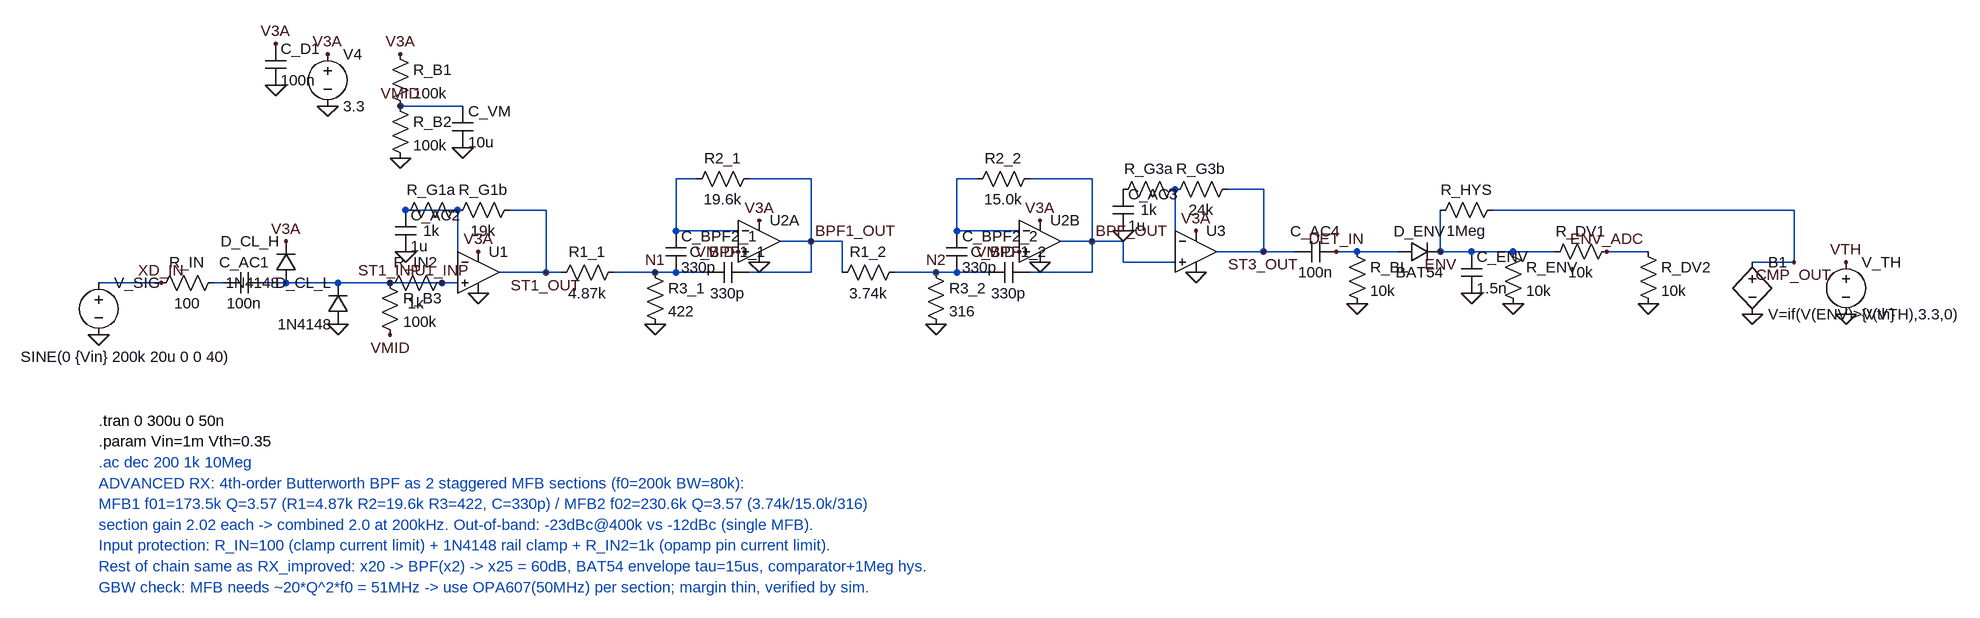
[diagram p0: schematic RX_advanced.asc]
RX_advanced.asc, the LTspice schematic file:
Version 4.1
SHEET 1 2400 900
WIRE -1552 208 -1456 208
WIRE -1376 208 -1360 208
WIRE -1296 208 -1264 208
WIRE -1264 208 -1184 208
WIRE -1184 208 -1104 208
WIRE -1104 208 -1024 208
WIRE -1024 208 -1000 208
WIRE -1088 -64 -992 -64
WIRE -1000 176 -1000 96
WIRE -1000 96 -1080 96
WIRE -920 96 -864 96
WIRE -864 96 -864 192
WIRE -936 192 -864 192
WIRE -864 192 -840 192
WIRE -760 192 -696 192
WIRE -696 192 -664 192
WIRE -664 192 -616 192
WIRE -664 128 -568 128
WIRE -664 128 -664 48
WIRE -664 48 -632 48
WIRE -552 48 -456 48
WIRE -456 48 -456 144
WIRE -504 144 -456 144
WIRE -456 144 -408 144
WIRE -552 192 -456 192
WIRE -456 192 -456 144
WIRE -408 144 -408 192
WIRE -328 192 -264 192
WIRE -264 192 -232 192
WIRE -232 192 -184 192
WIRE -232 128 -136 128
WIRE -232 128 -232 48
WIRE -232 48 -200 48
WIRE -120 48 -24 48
WIRE -24 48 -24 144
WIRE -72 144 -24 144
WIRE -24 144 24 144
WIRE -120 192 -24 192
WIRE -24 192 -24 144
WIRE 24 144 24 176
WIRE 24 176 104 176
WIRE 104 144 104 64
WIRE 184 64 240 64
WIRE 240 64 240 160
WIRE 168 160 240 160
WIRE 240 160 288 160
WIRE 352 160 384 160
WIRE 384 160 416 160
WIRE 416 160 448 160
WIRE 512 160 560 160
WIRE 560 160 624 160
WIRE 624 160 688 160
WIRE 512 160 512 96
WIRE 592 96 1056 96
WIRE 1056 96 1056 176
WIRE 992 176 1056 176
WIRE 768 160 832 160
FLAG -1552 288 0
FLAG -1200 -64 0
FLAG -1088 16 0
FLAG -992 0 0
FLAG -1280 -96 0
FLAG -1200 -144 V3A
FLAG -1280 -160 V3A
FLAG -1088 -144 V3A
FLAG -1088 -64 VMID
FLAG -1264 144 V3A
FLAG -1184 272 0
FLAG -1104 288 VMID
FLAG -1080 160 0
FLAG -968 160 V3A
FLAG -968 224 0
FLAG -696 272 0
FLAG -568 160 VMID
FLAG -536 112 V3A
FLAG -536 176 0
FLAG -264 272 0
FLAG -136 160 VMID
FLAG -104 112 V3A
FLAG -104 176 0
FLAG 24 128 0
FLAG 136 128 V3A
FLAG 136 192 0
FLAG 384 240 0
FLAG 560 224 0
FLAG 624 240 0
FLAG 832 240 0
FLAG 992 256 0
FLAG 1136 256 0
FLAG -1456 208 XD_IN
FLAG -1104 208 ST1_INP
FLAG -1024 208 U1_INP
FLAG -864 192 ST1_OUT
FLAG -696 192 N1
FLAG -456 144 BPF1_OUT
FLAG -264 192 N2
FLAG -24 144 BPF_OUT
FLAG 240 160 ST3_OUT
FLAG 352 160 DET_IN
FLAG 512 160 ENV
FLAG 768 160 ENV_ADC
FLAG 1056 176 CMP_OUT
FLAG 1136 176 VTH
SYMBOL voltage -1552 192 R0
WINDOW 3 -120 130 Left 2
SYMATTR InstName V_SIG
SYMATTR Value SINE(0 {Vin} 200k 20u 0 0 40)
SYMATTR Value2 AC 1
SYMBOL res -1360 192 R90
WINDOW 0 0 56 VBottom 2
WINDOW 3 32 56 VTop 2
SYMATTR InstName R_IN
SYMATTR Value 100
SYMBOL cap -1296 192 R90
WINDOW 0 0 32 VBottom 2
WINDOW 3 32 32 VTop 2
SYMATTR InstName C_AC1
SYMATTR Value 100n
SYMBOL diode -1248 208 R180
WINDOW 0 24 64 Left 2
WINDOW 3 24 0 Left 2
SYMATTR InstName D_CL_H
SYMATTR Value 1N4148
SYMBOL diode -1168 272 R180
WINDOW 0 24 64 Left 2
WINDOW 3 24 0 Left 2
SYMATTR InstName D_CL_L
SYMATTR Value 1N4148
SYMBOL res -1120 192 R0
SYMATTR InstName R_B3
SYMATTR Value 100k
SYMBOL res -1008 192 R90
WINDOW 0 0 56 VBottom 2
WINDOW 3 32 56 VTop 2
SYMATTR InstName R_IN2
SYMATTR Value 1k
SYMBOL voltage -1200 -160 R0
SYMATTR InstName V4
SYMATTR Value 3.3
SYMBOL cap -1296 -160 R0
SYMATTR InstName C_D1
SYMATTR Value 100n
SYMBOL res -1104 -160 R0
SYMATTR InstName R_B1
SYMATTR Value 100k
SYMBOL res -1104 -80 R0
SYMATTR InstName R_B2
SYMATTR Value 100k
SYMBOL cap -1008 -64 R0
SYMATTR InstName C_VM
SYMATTR Value 10u
SYMBOL OpAmps\\UniversalOpAmp2 -968 192 R0
SYMATTR InstName U1
SYMATTR Value2 Avol=1Meg GBW=50Meg Slew=20Meg
SYMBOL res -984 80 R90
WINDOW 0 0 56 VBottom 2
WINDOW 3 32 56 VTop 2
SYMATTR InstName R_G1a
SYMATTR Value 1k
SYMBOL cap -1096 96 R0
SYMATTR InstName C_AC2
SYMATTR Value 1u
SYMBOL res -904 80 R90
WINDOW 0 0 56 VBottom 2
WINDOW 3 32 56 VTop 2
SYMATTR InstName R_G1b
SYMATTR Value 19k
SYMBOL res -744 176 R90
WINDOW 0 0 56 VBottom 2
WINDOW 3 32 56 VTop 2
SYMATTR InstName R1_1
SYMATTR Value 4.87k
SYMBOL res -712 176 R0
SYMATTR InstName R3_1
SYMATTR Value 422
SYMBOL cap -680 128 R0
SYMATTR InstName C_BPF2_1
SYMATTR Value 330p
SYMBOL cap -552 176 R90
WINDOW 0 0 32 VBottom 2
WINDOW 3 32 32 VTop 2
SYMATTR InstName C_BPF1_1
SYMATTR Value 330p
SYMBOL res -536 32 R90
WINDOW 0 0 56 VBottom 2
WINDOW 3 32 56 VTop 2
SYMATTR InstName R2_1
SYMATTR Value 19.6k
SYMBOL OpAmps\\UniversalOpAmp2 -536 144 R0
SYMATTR InstName U2A
SYMATTR Value2 Avol=1Meg GBW=50Meg Slew=20Meg
SYMBOL res -312 176 R90
WINDOW 0 0 56 VBottom 2
WINDOW 3 32 56 VTop 2
SYMATTR InstName R1_2
SYMATTR Value 3.74k
SYMBOL res -280 176 R0
SYMATTR InstName R3_2
SYMATTR Value 316
SYMBOL cap -248 128 R0
SYMATTR InstName C_BPF2_2
SYMATTR Value 330p
SYMBOL cap -120 176 R90
WINDOW 0 0 32 VBottom 2
WINDOW 3 32 32 VTop 2
SYMATTR InstName C_BPF1_2
SYMATTR Value 330p
SYMBOL res -104 32 R90
WINDOW 0 0 56 VBottom 2
WINDOW 3 32 56 VTop 2
SYMATTR InstName R2_2
SYMATTR Value 15.0k
SYMBOL OpAmps\\UniversalOpAmp2 -104 144 R0
SYMATTR InstName U2B
SYMATTR Value2 Avol=1Meg GBW=50Meg Slew=20Meg
SYMBOL OpAmps\\UniversalOpAmp2 136 160 R0
SYMATTR InstName U3
SYMATTR Value2 Avol=1Meg GBW=50Meg Slew=20Meg
SYMBOL res 120 48 R90
WINDOW 0 0 56 VBottom 2
WINDOW 3 32 56 VTop 2
SYMATTR InstName R_G3a
SYMATTR Value 1k
SYMBOL cap 8 64 R0
SYMATTR InstName C_AC3
SYMATTR Value 1u
SYMBOL res 200 48 R90
WINDOW 0 0 56 VBottom 2
WINDOW 3 32 56 VTop 2
SYMATTR InstName R_G3b
SYMATTR Value 24k
SYMBOL cap 352 144 R90
WINDOW 0 0 32 VBottom 2
WINDOW 3 32 32 VTop 2
SYMATTR InstName C_AC4
SYMATTR Value 100n
SYMBOL res 368 144 R0
SYMATTR InstName R_BL
SYMATTR Value 10k
SYMBOL diode 448 176 R270
WINDOW 0 32 32 VTop 2
WINDOW 3 0 32 VBottom 2
SYMATTR InstName D_ENV
SYMATTR Value BAT54
SYMBOL cap 544 160 R0
SYMATTR InstName C_ENV
SYMATTR Value 1.5n
SYMBOL res 608 144 R0
SYMATTR InstName R_ENV
SYMATTR Value 10k
SYMBOL res 784 144 R90
WINDOW 0 0 56 VBottom 2
WINDOW 3 32 56 VTop 2
SYMATTR InstName R_DV1
SYMATTR Value 10k
SYMBOL res 816 144 R0
SYMATTR InstName R_DV2
SYMATTR Value 10k
SYMBOL res 608 80 R90
WINDOW 0 0 56 VBottom 2
WINDOW 3 32 56 VTop 2
SYMATTR InstName R_HYS
SYMATTR Value 1Meg
SYMBOL bv 992 160 R0
WINDOW 3 24 96 Left 2
SYMATTR InstName B1
SYMATTR Value V=if(V(ENV)>V(VTH),3.3,0)
SYMBOL voltage 1136 160 R0
SYMATTR InstName V_TH
SYMATTR Value {Vth}
TEXT -1552 420 Left 2 !.tran 0 300u 0 50n
TEXT -1552 452 Left 2 !.param Vin=1m Vth=0.35
TEXT -1552 484 Left 2 ;.ac dec 200 1k 10Meg
TEXT -1552 516 Left 2 ;ADVANCED RX: 4th-order Butterworth BPF as 2 staggered MFB sections (f0=200k BW=80k):
TEXT -1552 548 Left 2 ;MFB1 f01=173.5k Q=3.57 (R1=4.87k R2=19.6k R3=422, C=330p) / MFB2 f02=230.6k Q=3.57 (3.74k/15.0k/316)
TEXT -1552 580 Left 2 ;section gain 2.02 each -> combined 2.0 at 200kHz. Out-of-band: -23dBc@400k vs -12dBc (single MFB).
TEXT -1552 612 Left 2 ;Input protection: R_IN=100 (clamp current limit) + 1N4148 rail clamp + R_IN2=1k (opamp pin current limit).
TEXT -1552 644 Left 2 ;Rest of chain same as RX_improved: x20 -> BPF(x2) -> x25 = 60dB, BAT54 envelope tau=15us, comparator+1Meg hys.
TEXT -1552 676 Left 2 ;GBW check: MFB needs ~20*Q^2*f0 = 51MHz -> use OPA607(50MHz) per section; margin thin, verified by sim.

The netlist it stands for:
* RX_advanced.asc
V_SIG XD_IN 0 SINE(0 {Vin} 200k 20u 0 0 40) AC 1
R_IN N001 XD_IN 100
C_AC1 U1_INP N001 100n
D_CL_H U1_INP V3A 1N4148
D_CL_L 0 U1_INP 1N4148
R_B3 U1_INP VMID 100k
R_IN2 U1_INP U1_INP 1k
V4 V3A 0 3.3
C_D1 V3A 0 100n
R_B1 V3A VMID 100k
R_B2 VMID 0 100k
C_VM VMID 0 10u
X§U1 U1_INP N002 V3A 0 ST1_OUT level2 Avol=1Meg GBW=50Meg Slew=20Meg Ilimit=25m Rail=0 Vos=0 En=0 Enk=0 In=0 Ink=0 Rin=500Meg  ; pins In+ In- V+ V- OUT
R_G1a N002 N002 1k
C_AC2 N002 0 1u
R_G1b ST1_OUT N002 19k
R1_1 N1 ST1_OUT 4.87k
R3_1 N1 0 422
C_BPF2_1 N003 N1 330p
C_BPF1_1 BPF1_OUT N1 330p
R2_1 BPF1_OUT N003 19.6k
X§U2A VMID N003 V3A 0 BPF1_OUT level2 Avol=1Meg GBW=50Meg Slew=20Meg Ilimit=25m Rail=0 Vos=0 En=0 Enk=0 In=0 Ink=0 Rin=500Meg  ; pins In+ In- V+ V- OUT
R1_2 N2 BPF1_OUT 3.74k
R3_2 N2 0 316
C_BPF2_2 N004 N2 330p
C_BPF1_2 BPF_OUT N2 330p
R2_2 BPF_OUT N004 15.0k
X§U2B VMID N004 V3A 0 BPF_OUT level2 Avol=1Meg GBW=50Meg Slew=20Meg Ilimit=25m Rail=0 Vos=0 En=0 Enk=0 In=0 Ink=0 Rin=500Meg  ; pins In+ In- V+ V- OUT
X§U3 BPF_OUT N005 V3A 0 ST3_OUT level2 Avol=1Meg GBW=50Meg Slew=20Meg Ilimit=25m Rail=0 Vos=0 En=0 Enk=0 In=0 Ink=0 Rin=500Meg  ; pins In+ In- V+ V- OUT
R_G3a N005 P001 1k
C_AC3 P001 0 1u
R_G3b ST3_OUT N005 24k
C_AC4 DET_IN ST3_OUT 100n
R_BL DET_IN 0 10k
D_ENV DET_IN ENV BAT54
C_ENV ENV 0 1.5n
R_ENV ENV 0 10k
R_DV1 ENV_ADC ENV 10k
R_DV2 ENV_ADC 0 10k
R_HYS CMP_OUT ENV 1Meg
B1 CMP_OUT 0 V=if(V(ENV)>V(VTH),3.3,0)
V_TH VTH 0 {Vth}
.model D D
.lib standard.dio
.tran 0 300u 0 50n
.param Vin=1m Vth=0.35
* .ac dec 200 1k 10Meg
* ADVANCED RX: 4th-order Butterworth BPF as 2 staggered MFB sections (f0=200k BW=80k):
* MFB1 f01=173.5k Q=3.57 (R1=4.87k R2=19.6k R3=422, C=330p) / MFB2 f02=230.6k Q=3.57 (3.74k/15.0k/316)
* section gain 2.02 each -> combined 2.0 at 200kHz. Out-of-band: -23dBc@400k vs -12dBc (single MFB).
* Input protection: R_IN=100 (clamp current limit) + 1N4148 rail clamp + R_IN2=1k (opamp pin current limit).
* Rest of chain same as RX_improved: x20 -> BPF(x2) -> x25 = 60dB, BAT54 envelope tau=15us, comparator+1Meg hys.
* GBW check: MFB needs ~20*Q^2*f0 = 51MHz -> use OPA607(50MHz) per section; margin thin, verified by sim.
.lib UniversalOpAmp2.lib
.backanno
.end